# Altium schematic sheet Main.SchDoc
size A3; SheetNumber: 2; SheetTotal: 9
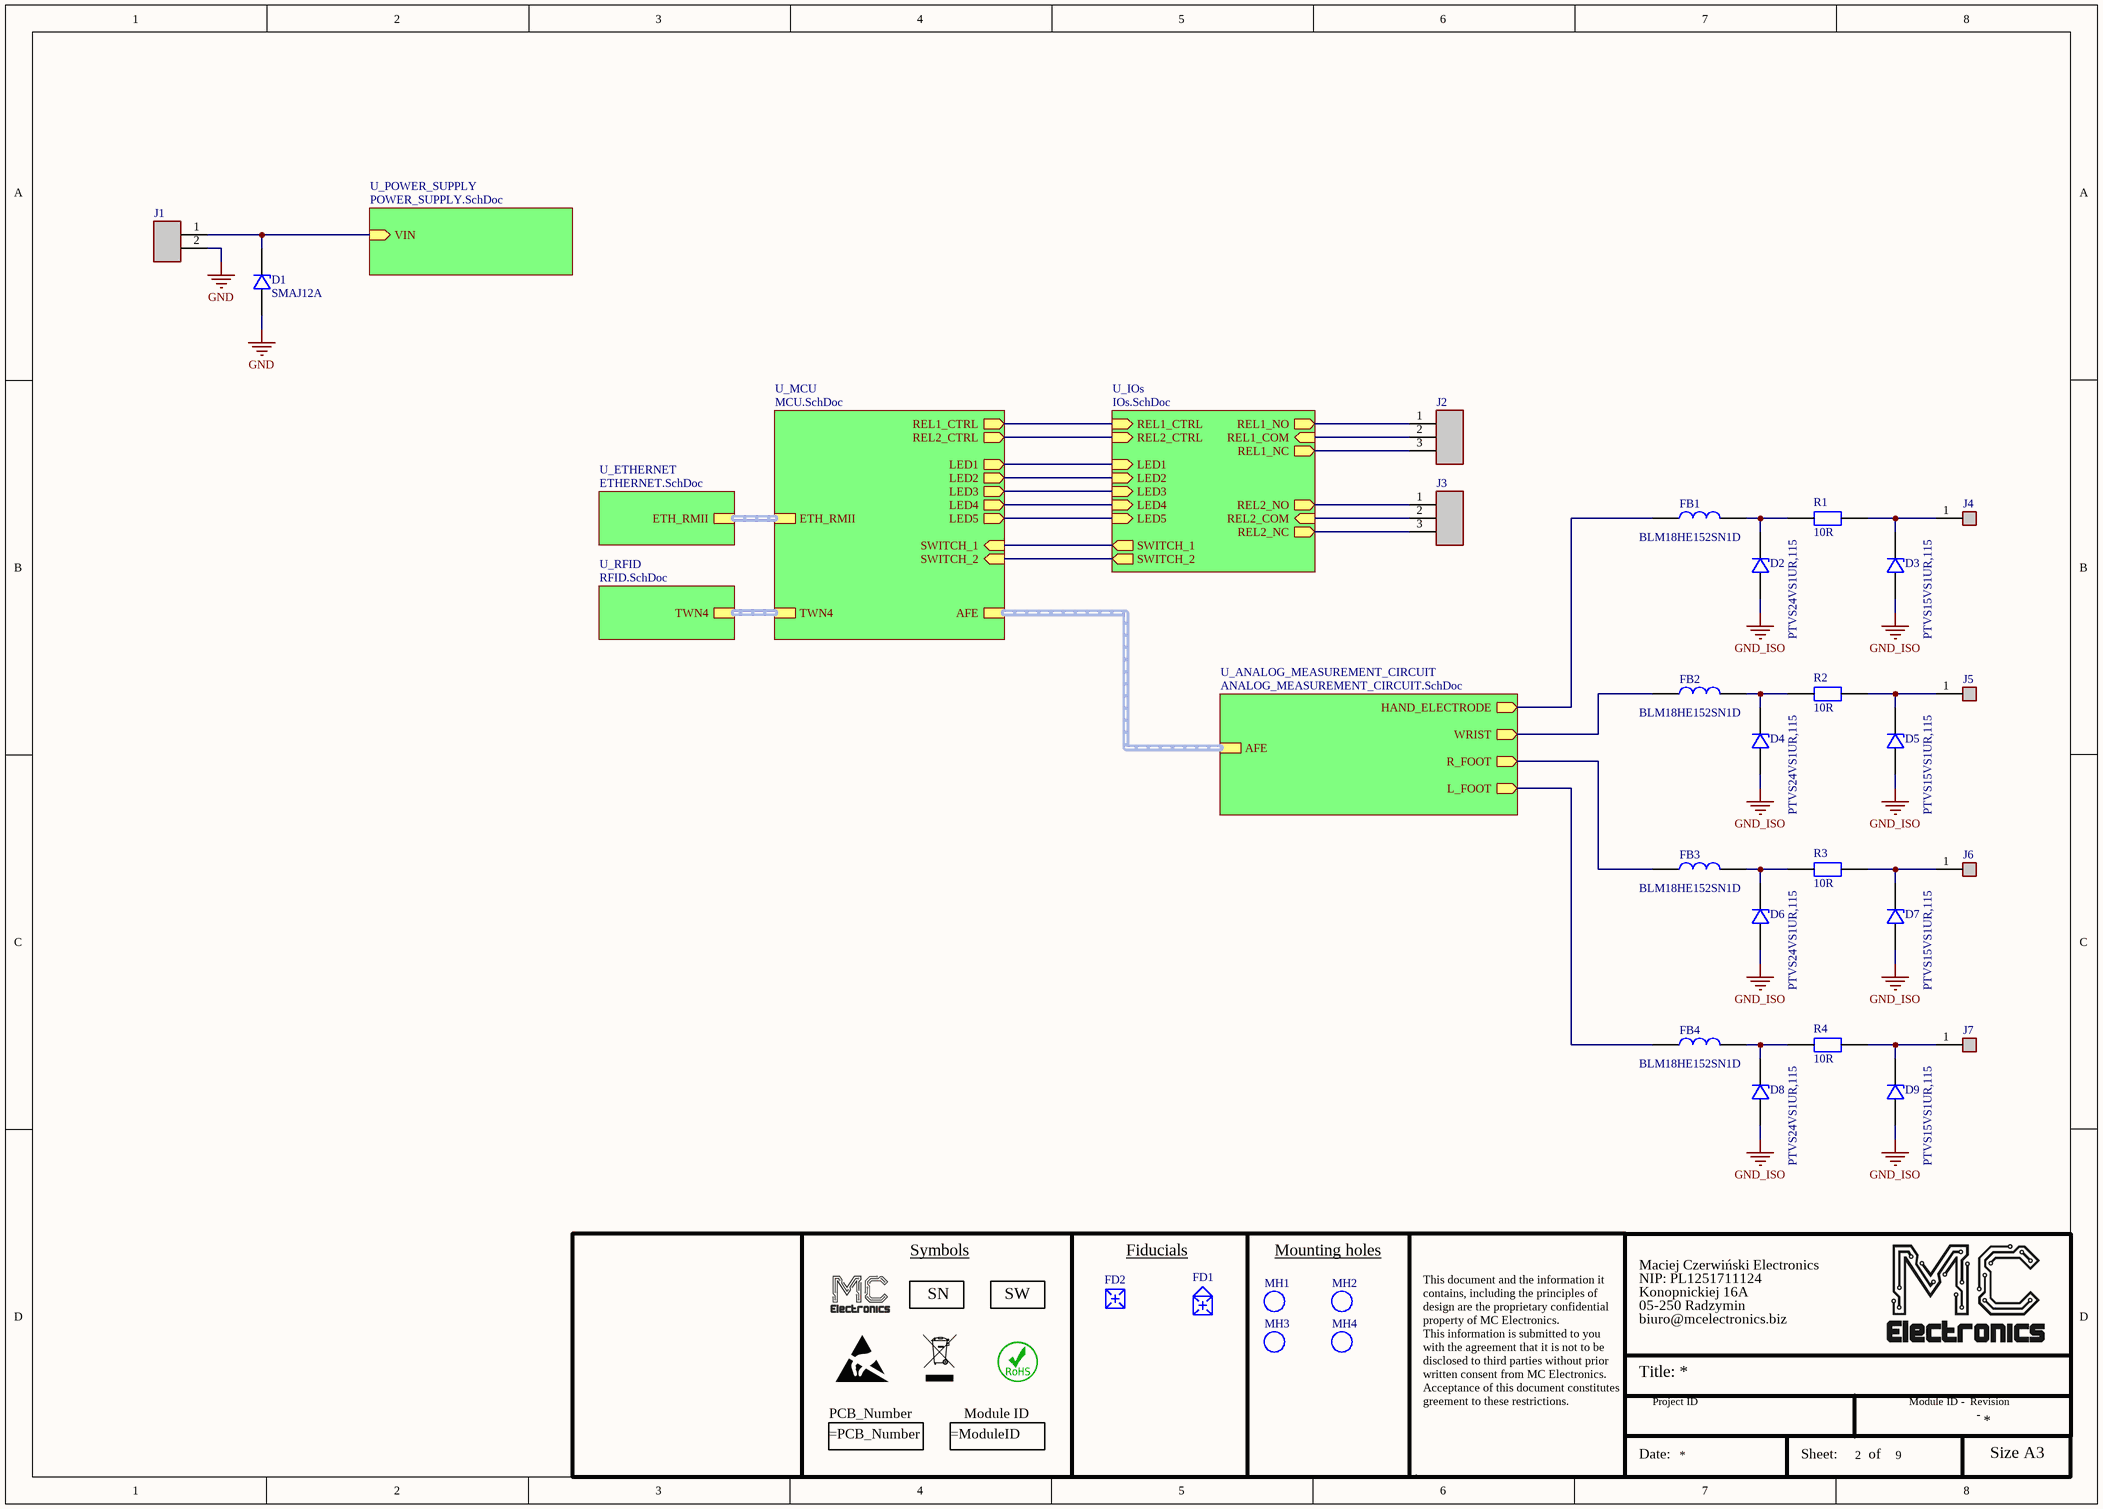
[diagram p0: Main.SchDoc]

## Parts
.PCB  PCB Number  [PCB number 60mils]  (value not drawn)
D1  SMAJ12A  [CAPM3216X18N]
D2  PTVS24VS1UR,115  [SOD123W]
D3  PTVS15VS1UR,115  [SOD123W]
D4  PTVS24VS1UR,115  [SOD123W]
D5  PTVS15VS1UR,115  [SOD123W]
D6  PTVS24VS1UR,115  [SOD123W]
D7  PTVS15VS1UR,115  [SOD123W]
D8  PTVS24VS1UR,115  [SOD123W]
D9  PTVS15VS1UR,115  [SOD123W]
FB1  BLM18HE152SN1D  [0603FB]
FB2  BLM18HE152SN1D  [0603FB]
FB3  BLM18HE152SN1D  [0603FB]
FB4  BLM18HE152SN1D  [0603FB]
FD1  Fiducial_house  [Fiducial_house_1mm]  (value not drawn)
FD2  Fiducial_square  [Fiducial_square_1mm]  (value not drawn)
J1  WE Terminal block 2x1 5.08mm  [WR-TBL Series 2365 1x2 5.08mm]  (value not drawn)
J2  WE Terminal block 3x1 5.08mm  [WR_TBL Series 2365 1x3 5,08mm]  (value not drawn)
J3  WE Terminal block 3x1 5.08mm  [WR_TBL Series 2365 1x3 5,08mm]  (value not drawn)
J4  Pin header male THT 1x1 2.54mm  [Pin header male THT 1x1 2,54mm]  (value not drawn)
J5  Pin header male THT 1x1 2.54mm  [Pin header male THT 1x1 2,54mm]  (value not drawn)
J6  Pin header male THT 1x1 2.54mm  [Pin header male THT 1x1 2,54mm]  (value not drawn)
J7  Pin header male THT 1x1 2.54mm  [Pin header male THT 1x1 2,54mm]  (value not drawn)
MH1  MHNP 3.2mm  [MHNP 3.2mm]  (value not drawn)  (no BOM)
MH2  MHNP 3.2mm  [MHNP 3.2mm]  (value not drawn)  (no BOM)
MH3  MHNP 3.2mm  [MHNP 3.2mm]  (value not drawn)  (no BOM)
MH4  MHNP 3.2mm  [MHNP 3.2mm]  (value not drawn)  (no BOM)
R1  value 10R  [2512R]  (hidden comment: 10R 1% 1.5W)
R2  value 10R  [2512R]  (hidden comment: 10R 1% 1.5W)
R3  value 10R  [2512R]  (hidden comment: 10R 1% 1.5W)
R4  value 10R  [2512R]  (hidden comment: 10R 1% 1.5W)
S1  Serial number place  [Serial number place 10x20mm]  (value not drawn)  (no BOM)
S2  SW rev. 8x16mm  [SW rev. 8x16mm]  (value not drawn)  (no BOM)
S3  MC Logo 10mm  [MC Logo 10mm]  (value not drawn)  (no BOM)
S4  ESD 10mm  [ESD 10mm]  (value not drawn)  (no BOM)
S5  WEEE 10mm  [WEEE 10mm]  (value not drawn)  (no BOM)
S6  RoHS 10mm  [RoHS 10mm]  (value not drawn)  (no BOM)
S7  Module ID 60mils  [Module ID 60mils]  (value not drawn)  (no BOM)

## Sub-sheets
U_ANALOG_MEASUREMENT_CIRCUIT = ANALOG_MEASUREMENT_CIRCUIT.SchDoc: HAND_ELECTRODE (out), WRIST (out), R_FOOT (out), L_FOOT (out), AFE (harness AFE)
U_ETHERNET = ETHERNET.SchDoc: ETH_RMII (harness ETH_RMII)
U_IOs = IOs.SchDoc: REL1_NO (out), REL2_NC (out), REL2_NO (out), REL1_NC (out), REL1_COM (in), REL2_COM (in), REL1_CTRL (in), REL2_CTRL (in), LED1 (in), LED2 (in), LED3 (in), LED4 (in), LED5 (in), SWITCH_1 (out), SWITCH_2 (out)
U_MCU = MCU.SchDoc: REL1_CTRL (out), REL2_CTRL (out), LED5 (out), LED4 (out), LED3 (out), LED2 (out), LED1 (out), ETH_RMII (harness ETH_RMII), TWN4 (harness TWN4), AFE (harness AFE), SWITCH_1 (in), SWITCH_2 (in)
U_POWER_SUPPLY = POWER_SUPPLY.SchDoc: VIN (in)
U_RFID = RFID.SchDoc: TWN4 (harness TWN4)

## Nets
GND: D1.2 J1.2
GND_ISO: D2.2 D3.2 D4.2 D5.2 D6.2 D7.2 D8.2 D9.2
NetD1_1: D1.1 J1.1 ; sheet U_POWER_SUPPLY/VIN
NetD2_1: D2.1 FB1.2 R1.2
NetD3_1: D3.1 J4.1 R1.1
NetD4_1: D4.1 FB2.2 R2.2
NetD5_1: D5.1 J5.1 R2.1
NetD6_1: D6.1 FB3.2 R3.2
NetD7_1: D7.1 J6.1 R3.1
NetD8_1: D8.1 FB4.2 R4.2
NetD9_1: D9.1 J7.1 R4.1
NetFB1_1: FB1.1 ; sheet U_ANALOG_MEASUREMENT_CIRCUIT/HAND_ELECTRODE
NetFB2_1: FB2.1 ; sheet U_ANALOG_MEASUREMENT_CIRCUIT/WRIST
NetFB3_1: FB3.1 ; sheet U_ANALOG_MEASUREMENT_CIRCUIT/R_FOOT
NetFB4_1: FB4.1 ; sheet U_ANALOG_MEASUREMENT_CIRCUIT/L_FOOT
NetJ2_1: J2.1 ; sheet U_IOs/REL1_NO
NetJ2_2: J2.2 ; sheet U_IOs/REL1_COM
NetJ2_3: J2.3 ; sheet U_IOs/REL1_NC
NetJ3_1: J3.1 ; sheet U_IOs/REL2_NO
NetJ3_2: J3.2 ; sheet U_IOs/REL2_COM
NetJ3_3: J3.3 ; sheet U_IOs/REL2_NC
(unnamed): sheet U_IOs/REL1_CTRL, sheet U_MCU/REL1_CTRL
(unnamed): sheet U_IOs/REL2_CTRL, sheet U_MCU/REL2_CTRL
(unnamed): sheet U_IOs/LED1, sheet U_MCU/LED1
(unnamed): sheet U_IOs/LED2, sheet U_MCU/LED2
(unnamed): sheet U_IOs/LED3, sheet U_MCU/LED3
(unnamed): sheet U_IOs/LED4, sheet U_MCU/LED4
(unnamed): sheet U_IOs/LED5, sheet U_MCU/LED5
(unnamed): sheet U_IOs/SWITCH_1, sheet U_MCU/SWITCH_1
(unnamed): sheet U_IOs/SWITCH_2, sheet U_MCU/SWITCH_2

## Buses and harness runs
harness sheet U_ANALOG_MEASUREMENT_CIRCUIT/AFE = sheet U_MCU/AFE
harness sheet U_ETHERNET/ETH_RMII = sheet U_MCU/ETH_RMII
harness sheet U_MCU/TWN4 = sheet U_RFID/TWN4

## Notes on the sheet
- Symbols
- Fiducials
- Mounting holes
- This document and the information it
- contains, including the principles of
- design are the proprietary confidential
- property of MC Electronics.
- Maciej Czerwiński Electronics
- NIP: PL1251711124
- Konopnickiej 16A
- 05-250 Radzymin
- biuro@mcelectronics.biz
- This information is submitted to you
- with the agreement that it is not to be
- disclosed to third parties without prior
- written consent from MC Electronics.
- Acceptance of this document constitutes
- Title:
- greement to these restrictions.
- Date:
- Project ID
- Sheet:
- of
- Module ID -
- Revision
- -
- Size A3
- (in symbol MC-CMP-012-00013-3) SN
- (in symbol MC-CMP-012-00014-5) SW
- (in symbol MC-CMP-012-00021-4) PCB_Number

## Library data of the parts
.PCB = MC-CMP-012-00021-4: Generic: No; PCB_Number: =PCB_Number; MC_ID: =PCB_Number; Mount type: SMT
D1 = SMAJ12A: TVS unidirectional 14V; Generic: No; MC_ID: TVS00040; Specific PN: SMAJ12A; Mount type: SMT
D2 D4 D6 D8 = PTVS24VS1UR,115: Diode: TVS; 400W; 28.1V; 10.3A; unidirectional; SOD123W; max.150°C; Generic: No; MC_ID: xx; Specific PN: PTVS24VS1UR,115; Mount type: SMT
D3 D5 D7 D9 = PTVS15VS1UR,115: Diode: TVS; 400W; 17.6V; 16.4A; unidirectional; SOD123W; max.150°C, 1nA; Generic: No; MC_ID: xx; Specific PN: PTVS15VS1UR,115; Mount type: SMT
FB1-FB4 = BLM18HE152SN1D: Ferryt: koralik; Imp.@ 100MHz: 1500Ω; SMD; 0,5A; 0603; R: 0,5Ω; BLM; Generic: No; MC_ID: FB00077; Specific PN: BLM18HE152SN1D; Mount type: SMT
FD1 = Fiducial_house: 1mm house fiducial; Generic: Yes; MC_ID: FID_H; Mount type: SMT
FD2 = Fiducial_square: 1mm square fiducial; Generic: Yes; MC_ID: FID_S; Mount type: SMT
J1 = WE_691236510002: Generic: Yes; MC_ID: CON00639; Mount type: THT; Specific PN: WE_691236510002
J2 J3 = WE_691236510003: Generic: Yes; MC_ID: CON00638; Mount type: THT; Specific PN: WE_691236510003
J4-J7 = GP_1x1: Pin header male THT 1x1 2.54mm vertical; Generic: Yes; MC_ID: -; Specific PN: GP_1x1; Mount type: THT
MH1-MH4 = MHNP 3.2mm: Mounting hole none plated, 3.2mm diameter; Generic: Yes; MC_ID: xx; Mount type: THT
R1-R4 = SPEC_10R_1%_1.5W_2512: Lead (Pb)-Bearing Pulse Proof, High Power Thick Film Chip Resistors 10R 2512; Specific PN: CRCW251210R0FKTGHP; Generic: No; MC_ID: R00765; Mount type: SMT
S1 = MC-CMP-012-00013-3: 10x20mm place for SN stick; Generic: No; Mount type: SMT; MC_ID: -
S2 = MC-CMP-012-00014-5: SW rev. place 8x16mm; Generic: No; Mount type: SMT; MC_ID: -
S3 = MC-CMP-012-00001-7: Generic: No; Mount type: SMT; MC_ID: -
S4 = MC-CMP-012-00005-7: ESD symbol 10mm; Generic: No; MC_ID: -; Mount type: SMT
S5 = MC-CMP-012-00009-5: WEEE bin symbol 10mm; Generic: No; MC_ID: -; Mount type: SMT
S6 = MC-CMP-012-00017-7: RoHS sign 10mm; Generic: No; Mount type: SMT; MC_ID: -
S7 = MC-CMP-012-00015-4: Module ID 60mils text height; Generic: No; Module ID: =ModuleID; MC_ID: -; Mount type: SMT